# EAGLE schematic Controller-Board-v2 (EAGLE 7.7.0)
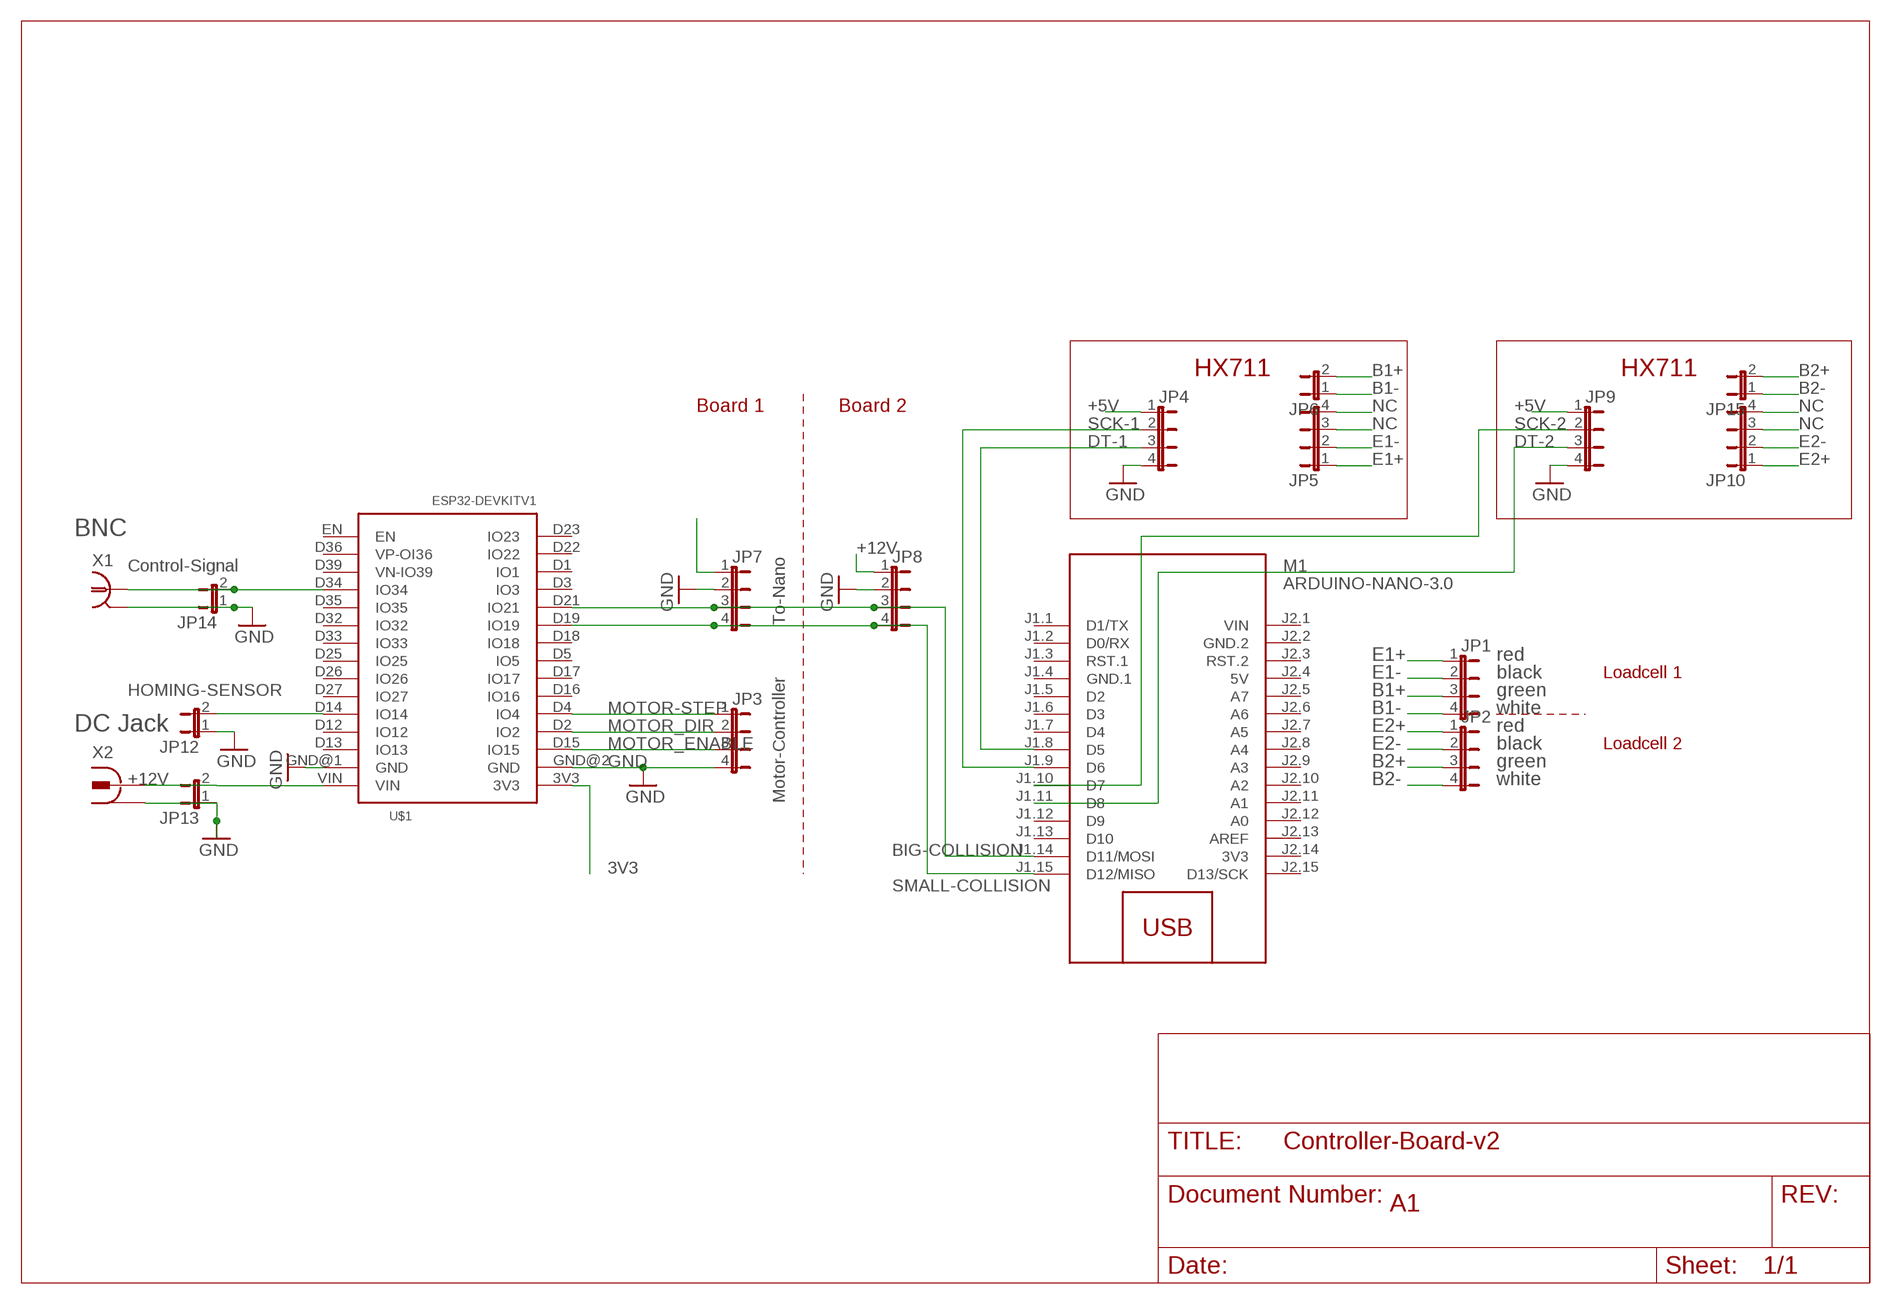
[diagram p0: schematic, sheet 1]

## Parts
JP1  JP4E  [JP4]
JP2  JP4E  [JP4]
JP3  JP4E  [JP4]
JP4  JP4E  [JP4]
JP5  JP4E  [JP4]
JP6  JP1E  [JP1]
JP7  JP4E  [JP4]
JP8  JP4E  [JP4]
JP9  JP4E  [JP4]
JP10  JP4E  [JP4]
JP12  JP1E  [JP1]
JP13  JP1E  [JP1]
JP14  JP1E  [JP1]
JP15  JP1E  [JP1]
M1  ARDUINO-NANO-3.0  [ARDUINO-NANO-3.0]
U$1  ESP32DEVKITV1  [ESP32-DEVKITV1]
X1  A1944-50  [A1944]
X2  736880-49  [736880-49]

## Nets
3V3: U$1.3V3
+5V: JP4.1 JP9.1
+12V: JP7.1 JP8.1
B1+: JP1.3 JP6.2
B1-: JP1.4 JP6.1
B2+: JP2.3 JP15.2
B2-: JP2.4 JP15.1
BIG-COLLISION: JP7.3 JP8.3 M1.J1.14(D11/MOSI) U$1.D21(IO21)
DT-1: JP4.3 M1.J1.8(D5)
DT-2: JP9.3 M1.J1.11(D8)
E1+: JP1.1 JP5.1
E1-: JP1.2 JP5.2
E2+: JP2.1 JP10.1
E2-: JP2.2 JP10.2
GND: JP3.4 JP4.4 JP7.2 JP8.2 JP9.4 JP12.1 JP13.1 JP14.1 U$1.GND@1(GND) U$1.GND@2(GND) X1.2 X1.3 X1.4 X1.5 X2.1 X2.1@1 X2.1@2
HOMING-SENSOR: JP12.2 U$1.D14(IO14)
MOTOR-STEP: JP3.1 U$1.D4(IO4)
MOTOR_DIR: JP3.2 U$1.D2(IO2)
MOTOR_ENABLE: JP3.3 U$1.D15(IO15)
N$1: JP14.2 U$1.D34(IO34) X1.1
N$3: JP13.2 U$1.VIN X2.2
NC: JP5.3 JP5.4 JP10.3 JP10.4
SCK-1: JP4.2 M1.J1.9(D6)
SCK-2: JP9.2 M1.J1.10(D7)
SMALL-COLLISION: JP7.4 JP8.4 M1.J1.15(D12/MISO) U$1.D19(IO19)
Unconnected: M1.J1.1(D1/TX) M1.J1.2(D0/RX) M1.J1.3(RST.1) M1.J1.5(D2) M1.J1.6(D3) M1.J1.7(D4) M1.J1.12(D9) M1.J1.13(D10) M1.J2.3(RST.2) M1.J2.5(A7) M1.J2.6(A6) M1.J2.7(A5) M1.J2.8(A4) M1.J2.9(A3) M1.J2.10(A2) M1.J2.11(A1) M1.J2.12(A0) M1.J2.13(AREF) M1.J2.15(D13/SCK) U$1.D1(IO1) U$1.D3(IO3) U$1.D5(IO5) U$1.D12(IO12) U$1.D13(IO13) U$1.D16(IO16) U$1.D17(IO17) U$1.D18(IO18) U$1.D22(IO22) U$1.D23(IO23) U$1.D25(IO25) U$1.D26(IO26) U$1.D27(IO27) U$1.D32(IO32) U$1.D33(IO33) U$1.D35(IO35) U$1.D36(VP-OI36) U$1.D39(VN-IO39) U$1.EN

## Notes on the sheet
- HX711 | HX711
- Board 1 | Board 2
- BNC
- Control-Signal
- To-Nano
- red
- black | Loadcell 1
- green
- white
- DC Jack | red
- black | Loadcell 2
- green
- +12V | white
- Motor-Controller
- A1

## Power pins joined to a net without a drawn wire
3V3: M1.J2.14(3V3)
5V: M1.J2.4(5V)
GND.1: M1.J1.4(GND.1)
GND.2: M1.J2.2(GND.2)
VIN: M1.J2.1(VIN)

## Library data of the parts
JP1-JP5 JP7-JP10 = jumper:JP4E: JUMPER
JP6 JP12-JP15 = jumper:JP1E: JUMPER
M1 = diy-modules:ARDUINO-NANO-3.0: Arduino Nano 3.0 and compatible devices More details available here: https://www.arduino.cc/en/Main/ArduinoBoardNano Click here to find device on ebay.com <http://www.ebay.com/sch/arduino+nano>
U$1 = ESP32DEVKITV1:ESP32DEVKITV1: Check prices <https://pricing.snapeda.com/parts/ESP32%20DEVKIT%20V1/Do%20it/view-part?ref=eda>; AVAILABILITY: No availability data; DESCRIPTION: Dual core, Wi-Fi: 2.4 GHz up to 150 Mbits/s,BLE (Bluetooth Low Energy) and legacy Bluetooth, 32 bits, Up to 240 MHz; MF: Do it; MP: ESP32 DEVKIT V1; PACKAGE: Package; PRICE: None
X1 = con-coax:A1944-50: BNC CONNECTOR 50 Ohm distributor Buerklin 78F2475; OC_FARNELL: unknown; OC_NEWARK: unknown
X2 = con-conrad:736880-49: Cinch Connector ( RCA Jack ) Cinch-Einbaukupplung 90º 72345 Vernickelt BKL Electronic Source: Conrad <http://www.conrad.de/ce/de/product/736880>

## Net classes
0 default: width 0.635 mm, drill 0.254 mm, clearance 0.254 mm
1 PWR: width 0.889 mm, drill 0.254 mm, clearance 0.254 mm